# Altium schematic sheet board.SchDoc: Display & buttons board
size A3; Revision: 1; SheetNumber: 6; SheetTotal: 29
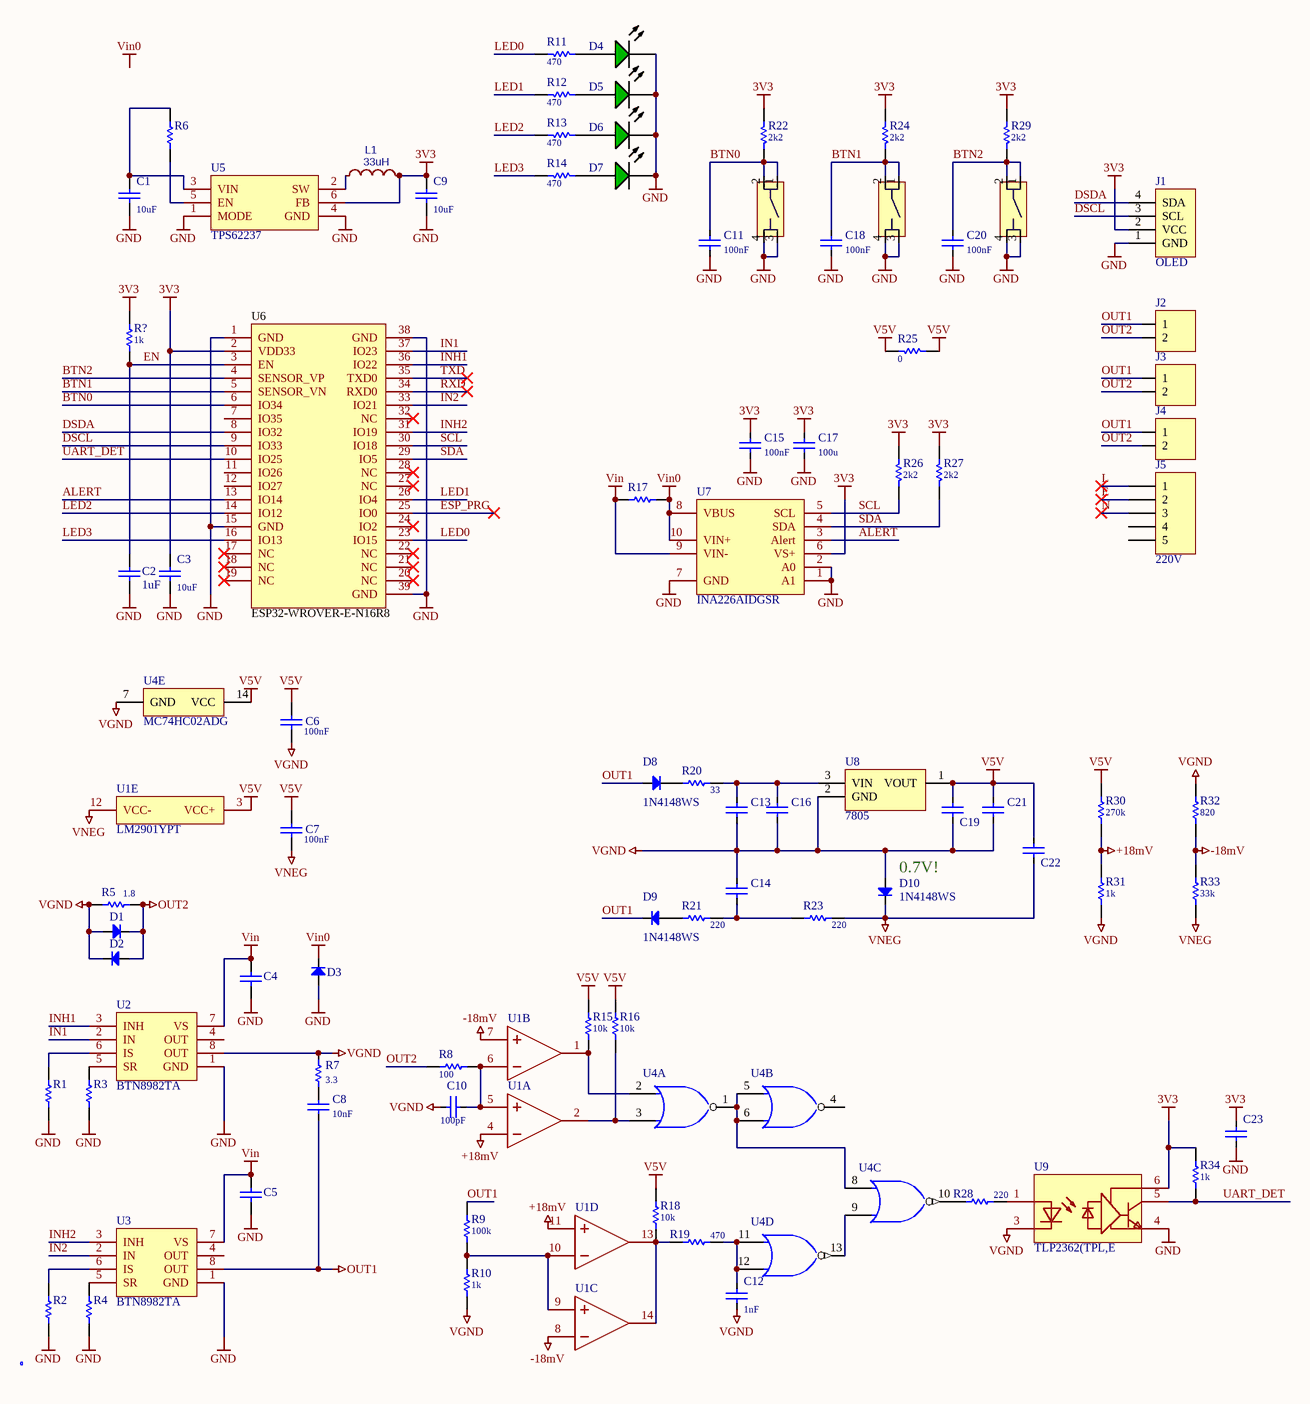
[diagram p0: board.SchDoc]

## Parts
C1  10uF  [C1206]
C2  1uF  [C0805]
C3  10uF  [C0805]
C4  4n7  [C1210-2.5MM]  (value not drawn)
C5  4n7  [C1210-2.5MM]  (value not drawn)
C6  100nF  [C0603]
C7  100nF  [C0603]
C8  10nF  [C0805]
C9  10uF  [C1206]
C10  100pF  [C0402]
C11  100nF  [C0402]
C12  1nF  [C0805]
C13  2u  [C1210-1.8MM]  (value not drawn)
C14  2u  [C1210-1.8MM]  (value not drawn)
C15  100nF  [C0402]
C16  2u  [C3528]  (value not drawn)
C17  100u  [C1206]
C18  100nF  [C0402]
C19  10u  [C1210-1.8MM]  (value not drawn)
C20  100nF  [C0402]
C21  2u  [C3528]  (value not drawn)
C22  10u  [C1206]  (value not drawn)
C23  10u  [C0805]  (value not drawn)
D1  SS36  [SMA]  (value not drawn)
D2  SS36  [SMA]  (value not drawn)
D3  (no value)  [SMC]
D4  GRN  [LED-0603-GRN]  (value not drawn)
D5  GRN  [LED-0603-GRN]  (value not drawn)
D6  GRN  [LED-0603-GRN]  (value not drawn)
D7  GRN  [LED-0603-GRN]  (value not drawn)
D8  1N4148WS  [SOD-123]
D9  1N4148WS  [SOD-123]
D10  1N4148WS  [SOD-123]
J1  OLED  [GME64128-02]
J2  (no value)  [CONN-TH_XY300V-A-5.0-2P]  (no BOM)
J3  (no value)  [CONN-TH_XY300V-A-5.0-2P]  (no BOM)
J4  (no value)  [CONN-TH_XY300V-A-5.0-2P]  (no BOM)
J5  220V  [AS-24]  (no BOM)
L1  33uH  [L2520]
LOGO1  LOGO  [LOGO]  (value not drawn)  (no BOM)
R1  (no value)  [R0603]
R2  (no value)  [R0603]
R3  (no value)  [R0603]
R4  (no value)  [R0603]
R5  1.8  [R1206]
R6  0  [R0603]  (value not drawn)
R7  3.3  [R1206]
R8  100  [R0603]
R9  100k  [R0603]
R10  1k  [R0603]
R11  470  [R0402]
R12  470  [R0402]
R13  470  [R0402]
R14  470  [R0402]
R15  10k  [R0603]
R16  10k  [R0603]
R17  (no value)  [R2512-WIDE]
R18  10k  [R0603]
R19  470  [R0603]
R20  33  [R0805]
R21  220  [R0805]
R22  2k2  [R0402]
R23  220  [R0603]
R24  2k2  [R0402]
R25  0  [R1206]
R26  2k2  [R0402]
R27  2k2  [R0402]
R28  220  [R0603]
R29  2k2  [R0402]
R30  270k  [R0603]
R31  1k  [R0603]
R32  820  [R0603]
R33  33k  [R0805]
R34  1k  [R0402]
R?  1k  [R0603]  (graphical)
SW1  PTS810SJS250  [BTN_PTS810]  (value not drawn)
SW2  PTS810SJS250  [BTN_PTS810]  (value not drawn)
SW3  PTS810SJS250  [BTN_PTS810]  (value not drawn)
U1  LM2901YPT  [TSSOP-14_L5.0-W4.4-P0.65-LS6.4-BL]  (value not drawn)  (parts A,B,C,D,E of 5)
U2  BTN8982TA  [TO-263-7_L10.2-W10.4-P1.27-LS14.4-TL]
U3  BTN8982TA  [TO-263-7_L10.2-W10.4-P1.27-LS14.4-TL]
U4  MC74HC02ADG  [SOIC-14]  (value not drawn)  (parts A,B,C,D,E of 5)
U5  TPS62237  [SON-6_L1.5-W1.0-P0.50-BL]
U6  ESP32-WROVER-E-N16R8  [WIFIM-SMD_39P-L31.4-W18.0-P1.27_2]
U7  INA226AIDGSR  [VSSOP-10 (3x3x0.5)]
U8  7805  [SOT-89]
U9  TLP2362(TPL,E  [OPTO-SMD-5_L3.7-W4.6-P1.27-LS7.0-BR]

## Nets
3V3: C3.2 C9.2 C15.1 C17.1 C23.1 J1.2(VCC) L1.2 R22.2 R24.2 R26.2 R27.2 R29.2 R34.1 R?.1 U5.6(FB) U6.2(VDD33) U7.6(VS+) U9.6
+18mV: R30.1 R31.1 U1.4(IN1-) U1.11(IN4+)
-18mV: R32.1 R33.1 U1.7(IN2+) U1.8(IN3-)
GND: C1.1 C2.1 C3.1 C4.2 C5.2 C9.1 C11.2 C15.2 C17.2 C18.2 C20.2 C23.2 D3.1(-) D4.2(K) D5.2(K) D6.2(K) D7.2(K) J1.1(GND) R1.1 R2.1 R3.1 R4.1 SW1.3 SW1.4 SW2.3 SW2.4 SW3.3 SW3.4 U2.1(GND) U3.1(GND) U5.1(MODE) U5.4(GND) U6.1(GND) U6.15(GND) U6.38(GND) U6.39(GND) U7.1(A1) U7.2(A0) U7.7(GND) U9.4
OUT1: C8.1 D8.1(-) D9.2(+) J2.1 J3.1 J4.1 R9.1 U3.8(OUT)
OUT2: D1.2(+) D2.1(-) J2.2 J3.2 J4.2 R5.2 R8.2
V5V: C6.1 C7.1 C19.1 C21.1 C22.1 R15.1 R16.1 R18.1 R25.1 R25.2 R30.2 U1.3(VCC+) U4.14(VCC) U8.1(VOUT)
VGND: C6.2 C10.2 C12.2 C13.2 C14.1 C16.2 C19.2 C21.2 D1.1(-) D2.2(+) D10.1(-) R5.1 R7.2 R10.2 R31.2 R32.2 U2.8(OUT) U4.7(GND) U8.2(GND) U9.3
Vin: C4.1 C5.1 R17.1 U2.7(VS) U3.7(VS) U7.9(VIN-)
Vin0: D3.2(+) R17.2 U7.8(VBUS) U7.10(VIN+)
VNEG: C7.2 C22.2 D10.2(+) R23.2 R33.2 U1.12(VCC-)
ALERT: U6.13(IO14) U7.3(Alert)
BTN0: C11.1 R22.1 SW1.1 SW1.2 U6.6(IO34)
BTN1: C18.1 R24.1 SW2.1 SW2.2 U6.5(SENSOR_VN)
BTN2: C20.1 R29.1 SW3.1 SW3.2 U6.4(SENSOR_VP)
DSCL: J1.3(SCL) U6.9(IO33)
DSDA: J1.4(SDA) U6.8(IO32)
E: J5.2
EN: C2.2 R?.2 U6.3(EN)
ESP_PRG: U6.25(IO0)
IN1: U2.2(IN) U6.37(IO23)
IN2: U3.2(IN) U6.33(IO21)
INH1: U2.3(INH) U6.36(IO22)
INH2: U3.3(INH) U6.31(IO19)
L: J5.1
LED0: R11.2 U6.23(IO15)
LED1: R12.2 U6.26(IO4)
LED2: R13.2 U6.14(IO12)
LED3: R14.2 U6.16(IO13)
N: J5.3
RXD: U6.34(RXD0)
SCL: R26.1 U6.30(IO18) U7.5(SCL)
SDA: R27.1 U6.29(IO5) U7.4(SDA)
TXD: U6.35(TXD0)
UART_DET: R34.2 U6.10(IO25) U9.5
NetC1_2: C1.2 R6.1 U5.3(VIN)
NetC8_2: C8.2 R7.1
NetC10_1: C10.1 R8.1 U1.5(IN1+) U1.6(IN2-)
NetC12_1: C12.1 R19.1 U4.11(4A) U4.12(4B)
NetC13_1: C13.1 C16.1 R20.2 U8.3(VIN)
NetC14_2: C14.2 R21.2 R23.1
NetD4_1: D4.1(A) R11.1
NetD5_1: D5.1(A) R12.1
NetD6_1: D6.1(A) R13.1
NetD7_1: D7.1(A) R14.1
NetD8_2: D8.2(+) R20.1
NetD9_1: D9.1(-) R21.1
NetL1_1: L1.1 U5.2(SW)
NetR1_2: R1.2 U2.6(IS)
NetR2_2: R2.2 U3.6(IS)
NetR3_2: R3.2 U2.5(SR)
NetR4_2: R4.2 U3.5(SR)
NetR6_2: R6.2 U5.5(EN)
NetR9_2: R9.2 R10.1 U1.9(IN3+) U1.10(IN4-)
NetR15_2: R15.2 U1.1(OUT2) U4.2(1A)
NetR16_2: R16.2 U1.2(OUT1) U4.3(1B)
NetR18_2: R18.2 R19.2 U1.13(OUT4) U1.14(OUT3)
NetR28_1: R28.1 U9.1
NetR28_2: R28.2 U4.10(3Y)
NetU4_1: U4.1(1Y) U4.5(2A) U4.6(2B) U4.8(3A)
NetU4_9: U4.9(3B) U4.13(4Y)

Not connected (* = marked no-connect by the designer): J5 4 5; U2 4(OUT); U3 4(OUT); U4 4(2Y); U6 7(IO35) 11(IO26) 12(IO27) 17(NC)* 18(NC)* 19(NC)* 20(NC)* 21(NC)* 22(NC)* 24(IO2)* 27(NC)* 28(NC)* 32(NC)*

## Notes on the sheet
- (near D10) 0.7V!
- Labels drawn without touching a wire or pin: Vin0

## Library data of the parts
C1 C9 = CAP: 10uf 50V 1206
C2 = Cap
C3 C8 C10-C15 C17-C20 C22 C23 = CAP
C4 C5 = CAP: 4n7 0402
C6 C7 = CAP: 100nF 0402
C16 C21 = CAP: B
D1-D3 D8 D9 = NCP51460SN33T1G: P/N: SMCJ24A; LCSC part number: C693617
D4-D7 = LED-0603-GREEN: LED 0603 GRN; P/N: SZYY0603G; LCSC part number: C434420
D10 = NCP51460SN33T1G: 1N4148; P/N: SMCJ24A; LCSC part number: C693617
J1 = Header 8
J2-J4 = Header 2
J5 = Header 5
L1 = 4.7uH: P/N: FXL0420-4R7-M; LCSC part number: C167208
R1-R4 R6 = RES
R5 R7-R34 = RES: P/N: RC0402FR-0718KL; LCSC part number: C138044
R? = RES: 1k 0603
SW1-SW3 = Component_1: P/N: PTS810SJK250SMTRLFS; LCSC part number: C221896
U1 = LM2901YPT: Manufacturer: ST(意法半导体); Add into BOM: yes; Number of Channels: 4; Vos - Input Offset Voltage: 1mV; Ib - Input Bias Current: 25nA; Propagation Delay Time: 1.3us; Output Mode: MOS；DTL；CMOS；TTL；ECL; Quiescent Current: 1.1mA; Maximum Power Supply Range (Vdd-Vss): 36V; Single Supply: 2V~36V; Dual Supply: 1V~18V；-18V~-1V; Input Offset Current(Ios): 5nA; Symbol: LM2901YPT; Device: LM2901YPT; LCSC Part Name: 低功耗四电压比较器; Supplier Part: C163544; Manufacturer Part: LM2901YPT; Supplier Footprint: TSSOP-14; JLCPCB Part Class: Extended Part; Datasheet: https://item.szlcsc.com/datasheet/LM2901YPT/174926.html; Supplier: LCSC; Convert to PCB: yes; Input Hysteresis Voltage (Vhys): -; Common Mode Rejection Ratio(CMRR): -; Output Type: -; Operating Temperature: -40℃~+125℃; Response Time (tr): 1.3us
U2 U3 = BTN8982TA: Manufacturer: Infineon(英飞凌); Symbol: BTN8982TAAUMA1; Add into BOM: yes; Device: BTN8982TA; LCSC Part Name: BTN8982TA; Supplier Part: C74175; Manufacturer Part: BTN8982TA; Supplier Footprint: TO-263-7; JLCPCB Part Class: Extended Part; Datasheet: https://item.szlcsc.com/datasheet/BTN8982TA/75294.html; Supplier: LCSC; Convert to PCB: yes
U4 = MC74HC02ADG: Logic Quad 2-Input NOR Gates; PN: MC74HC02ADG; ComponentLink2Description: Datasheet; ComponentLink2URL: http://www.ti.com/lit/ds/symlink/cd74hc02.pdf; Value: MC74HC02
U6 = ESP32-WROVER-E-N16R8: Manufacturer: ESPRESSIF(乐鑫); Symbol: ESP32-WROVER-E(16MB); Add into BOM: yes; Device: ESP32-WROVER-E-N16R8; LCSC Part Name: 通用型Wi-Fi+BT+BLE MCU模组; Supplier Part: C529589; Manufacturer Part: ESP32-WROVER-E-N16R8; Supplier Footprint: SMD,18x31.4mm; JLCPCB Part Class: Extended Part; Datasheet: https://atta.szlcsc.com/upload/public/pdf/source/20241030/69A66968DE36EDB45130F1579BF46A5B.pdf; Supplier: LCSC; Convert to PCB: yes
U7 = INA226AIDGSR: Manufacturer: TI(德州仪器); Add into BOM: yes; Vcm - Common Mode Voltage: 300mV~40V; Ib - Input Bias Current: 10nA; Vos - Input Offset Voltage: 2.5uV; Differential Voltage: -40V~+40V; Single Supply: 2.7V~5.5V; Quiescent Current: 330uA; Input Offset Voltage Drift(Vos TC): 0.1uV/℃; Common Mode Rejection Ratio (CMRR): 140dB; Symbol: INA226AIDGSR; Device: INA226AIDGSR; LCSC Part Name: 高侧/低侧测量双向电流/功率监视器，具有I²C兼容接口; Supplier Part: C49851; Manufacturer Part: INA226AIDGSR; Supplier Footprint: VSOP-10; JLCPCB Part Class: Extended Part; Datasheet: https://item.szlcsc.com/datasheet/INA226AIDGSR/50860.html; Supplier: LCSC; Convert to PCB: yes; Number of Channels: -; Gain: -; Bandwidth: -; Operating Temperature: -40℃~+125℃; Maximum Power Supply Range (Vdd-Vss): -; Dual Supply: -; Output Current: -; Input Offset Current(Ios): -; Input Offset Current Drift (Ios TC): -; Slew Rate: -; Noise density(eN): -
U8 = Component_4_1: XC6206P332MR
U9 = TLP2362(TPL,E_C37658: Manufacturer: TOSHIBA(东芝); Symbol: TLP2362(TPL,E(T; Add into BOM: yes; Input Type: DC; Voltage - Supply: 2.7V~5.5V; Isolation Voltage(Vrms): 3.75kV; CMTI(kV/us): 25kV/us; Data Rate: 10Mbps; Number of Channels: 1; Low level Delay Time: 100ns; Input threshold current: 5mA; Output current: 25mA; power dissipation: 60mW; Output voltage: 6V; Voltage - Forward(Vf): 1.55V; Reverse Voltage: 5V; Forward Current(If): 14mA; Device: TLP2362(TPL,E_C37658; LCSC Part Name: DC输入 1通道 隔离电压(rms):3750V; Supplier Part: C37658; Manufacturer Part: TLP2362(TPL,E; Supplier Footprint: SO-5; JLCPCB Part Class: Extended Part; Datasheet: https://item.szlcsc.com/datasheet/TLP2362(TPL%252CE/38638.html; Supplier: LCSC; Convert to PCB: yes; Operating Temperature: -40℃~+125℃; High level Delay Time: 100ns